# EAGLE design CPUinterface (EAGLE 9.6.2)
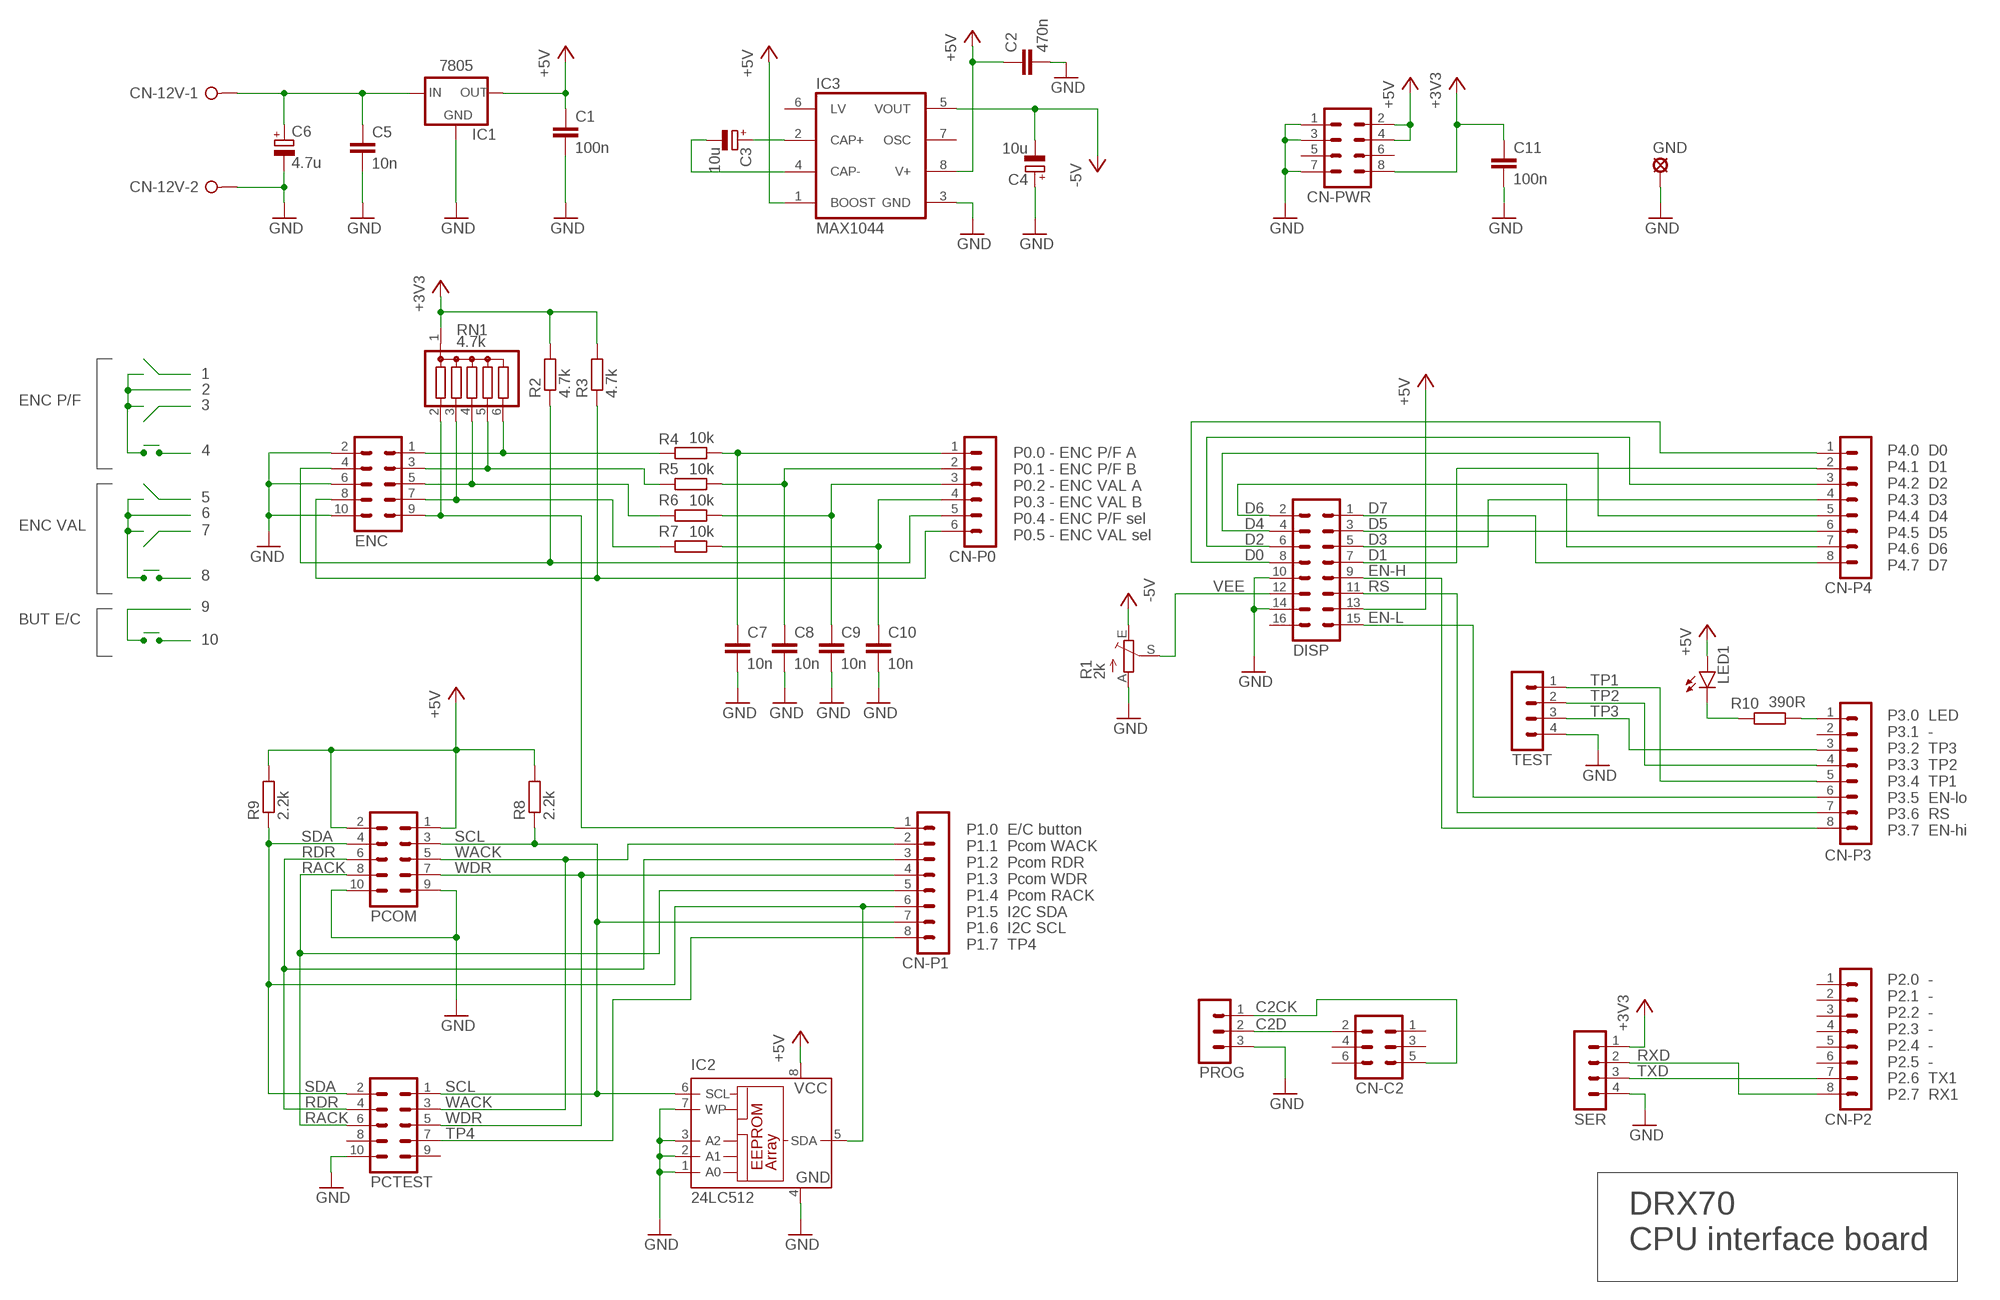
[diagram p0: schematic, sheet 1]

## Parts
C1  100n  C-EUC0805  [C0805]
C2  470n  C-EUC0603  [C0603]
C3  10u  CPOL-EUE2.5-6  [E2,5-6]
C4  10u  CPOL-EUE2.5-6  [E2,5-6]
C5  10n  C-EUC0603  [C0603]
C6  4.7u  CPOL-EUSMCA  [SMC_A]
C7  10n  C-EUC0603  [C0603]
C8  10n  C-EUC0603  [C0603]
C9  10n  C-EUC0603  [C0603]
C10  10n  C-EUC0603  [C0603]
C11  100n  C-EUC0805  [C0805]
CN-12V  W237-02P  [W237-132]
CN-C2  MA03-2  [MA03-2]
CN-P0  MA06-1  [MA06-1]
CN-P1  MA08-1  [MA08-1]
CN-P2  MA08-1  [MA08-1]
CN-P3  MA08-1  [MA08-1]
CN-P4  MA08-1  [MA08-1]
CN-PWR  MA04-2  [MA04-2]
DISP  MA08-2  [MA08-2]
ENC  MA05-2  [MA05-2]
GND  LSP10  [LSP10]
IC1  7805  78XXL  [78XXL]
IC2  24LC512  24C04ASN  [SO-08]
IC3  MAX1044  ICL7660CPA  [DIL08]
LED1  LED3MM  [LED3MM]
PCOM  MA05-2  [MA05-2]
PCTEST  MA05-2  [MA05-2]
PROG  MA03-1  [MA03-1]
R1  2k  TRIM_EU-S63X  [S63X]
R2  4.7k  R-EU_R0805  [R0805]
R3  4.7k  R-EU_R0805  [R0805]
R4  10k  R-EU_R0805  [R0805]
R5  10k  R-EU_R0805  [R0805]
R6  10k  R-EU_R0805  [R0805]
R7  10k  R-EU_R0805  [R0805]
R8  2.2k  R-EU_R0805  [R0805]
R9  2.2k  R-EU_R0805  [R0805]
R10  390R  R-EU_R0805  [R0805]
RN1  4.7k  G05R  [SIL6]
SER  MA04-1  [MA04-1]
TEST  MA04-1  [MA04-1]

## Nets
+3V3: C11.1 CN-PWR.8 R2.2 R3.2 RN1.1 SER.1
+5V: C1.1 C2.1 CN-PWR.2 CN-PWR.4 DISP.13 IC1.OUT IC2.8(VCC) IC3.1(BOOST) IC3.8(V+) LED1.A PCOM.1 PCOM.2 R8.2 R9.2
+12V: C5.1 C6.+ CN-12V.1 IC1.IN
-5V: C4.- IC3.5(VOUT) R1.E
C2CK: CN-C2.5 PROG.1
C2D: CN-C2.2 PROG.2
D0: CN-P4.1 DISP.8
D1: CN-P4.2 DISP.7
D2: CN-P4.3 DISP.6
D3: CN-P4.4 DISP.5
D4: CN-P4.5 DISP.4
D5: CN-P4.6 DISP.3
D6: CN-P4.7 DISP.2
D7: CN-P4.8 DISP.1
EN-H: CN-P3.8 DISP.9
EN-L: CN-P3.6 DISP.15
GND: C1.2 C2.2 C4.+ C5.2 C6.- C7.2 C8.2 C9.2 C10.2 C11.2 CN-12V.2 CN-PWR.1 CN-PWR.3 CN-PWR.7 DISP.10 DISP.14 ENC.2 ENC.6 ENC.10 GND.MP IC1.GND IC2.1(A0) IC2.2(A1) IC2.3(A2) IC2.4(GND) IC2.7(WP) IC3.3(GND) PCOM.9 PCOM.10 PCTEST.10 PROG.3 R1.A SER.4 TEST.4
N$1: C3.+ IC3.2(CAP+)
N$2: C3.- IC3.4(CAP-)
N$4: CN-P3.1 R10.1
N$16: ENC.1 R4.2 RN1.6
N$18: ENC.3 R5.2 RN1.5
N$20: ENC.5 R6.2 RN1.4
N$21: ENC.7 R7.2 RN1.3
N$22: LED1.K(C) R10.2
N$24: CN-P1.1 ENC.9 RN1.2
N$25: C10.1 CN-P0.4 R7.1
N$26: C9.1 CN-P0.3 R6.1
N$27: C8.1 CN-P0.2 R5.1
N$28: C7.1 CN-P0.1 R4.1
N$29: CN-P0.6 ENC.8 R3.1
N$30: CN-P0.5 ENC.4 R2.1
RACK: CN-P1.5 PCOM.8 PCTEST.6
RDR: CN-P1.3 PCOM.6 PCTEST.4
RS: CN-P3.7 DISP.11
RXD: CN-P2.8 SER.2
SCL: CN-P1.7 IC2.6(SCL) PCOM.3 PCTEST.1 R8.1
SDA: CN-P1.6 IC2.5(SDA) PCOM.4 PCTEST.2 R9.1
TP1: CN-P3.5 TEST.1
TP2: CN-P3.4 TEST.2
TP3: CN-P3.3 TEST.3
TP4: CN-P1.8 PCTEST.7
TXD: CN-P2.7 SER.3
VEE: DISP.12 R1.S
WACK: CN-P1.2 PCOM.5 PCTEST.3
WDR: CN-P1.4 PCOM.7 PCTEST.5
Unconnected: CN-C2.1 CN-C2.3 CN-C2.4 CN-C2.6 CN-P2.1 CN-P2.2 CN-P2.3 CN-P2.4 CN-P2.5 CN-P2.6 CN-P3.2 CN-PWR.5 CN-PWR.6 DISP.16 IC3.6(LV) IC3.7(OSC) PCTEST.8 PCTEST.9

## Notes on the sheet
- 1
- 2
- ENC P/F
- 3
- 4
- 5
- 6
- ENC VAL
- 7
- P0.0 - ENC P/F A
  P0.1 - ENC P/F B
  P0.2 - ENC VAL A
  P0.3 - ENC VAL B
  P0.4 - ENC P/F sel
  P0.5 - ENC VAL sel
- 8
- P4.0  D0
  P4.1  D1
  P4.2  D2
  P4.3  D3
  P4.4  D4
  P4.5  D5
  P4.6  D6
  P4.7  D7
- 9
- BUT E/C
- 10
- P3.0  LED
  P3.1  -
  P3.2  TP3
  P3.3  TP2
  P3.4  TP1
  P3.5  EN-lo
  P3.6  RS
  P3.7  EN-hi
- P1.0  E/C button
  P1.1  Pcom WACK
  P1.2  Pcom RDR
  P1.3  Pcom WDR
  P1.4  Pcom RACK
  P1.5  I2C SDA
  P1.6  I2C SCL
  P1.7  TP4
- P2.0  -
  P2.1  -
  P2.2  -
  P2.3  -
  P2.4  -
  P2.5  -
  P2.6  TX1
  P2.7  RX1
- DRX70
  CPU interface board

## Library data of the parts
C1 C2 C5 C7-C11 = rcl:C-EU: CAPACITOR, European symbol; SPICEPREFIX: C
C3 C4 C6 = rcl:CPOL-EU: POLARIZED CAPACITOR, European symbol; SPICEPREFIX: C
CN-12V = con-wago-508:W237-02P: WAGO SREW CLAMP; OC_FARNELL: unknown; OC_NEWARK: unknown
CN-C2 = con-lstb:MA03-2: PIN HEADER; OC_FARNELL: unknown; OC_NEWARK: unknown
CN-P0 = con-lstb:MA06-1: PIN HEADER; OC_FARNELL: unknown; OC_NEWARK: unknown
CN-P1-CN-P4 = con-lstb:MA08-1: PIN HEADER; OC_FARNELL: unknown; OC_NEWARK: unknown
CN-PWR = con-lstb:MA04-2: PIN HEADER; OC_FARNELL: unknown; OC_NEWARK: unknown
DISP = con-lstb:MA08-2: PIN HEADER; OC_FARNELL: unknown; OC_NEWARK: unknown
ENC PCOM PCTEST = con-lstb:MA05-2: PIN HEADER; OC_FARNELL: unknown; OC_NEWARK: unknown
GND = solpad:LSP10: SOLDER PAD drill 1.0 mm, distributor Buerklin, 12H555
IC1 = v-reg:78XXL: VOLTAGE REGULATOR
IC2 = microchip:24C*: Serial EEPROM 1 K/2 K/4 K; OC_FARNELL: unknown; OC_NEWARK: unknown
IC3 = maxim-2:ICL7660CPA: VOLTAGE CONVERTER; MF: INTERSIL; MPN: ICL7660CPA; OC_FARNELL: 1018170; OC_NEWARK: 06F7441
LED1 = led:LED: LED OSRAM: - CHIPLED LG R971, LG N971, LY N971, LG Q971, LY Q971, LO R971, LY R971 LH N974, LH R974 LS Q976, LO Q976, LY Q976 LO Q996 - Hyper CHIPLED LW Q18S LB Q993, LB Q99A, LB R99A - SideLED LS A670, LO A670, LY A670, LG A670, LP A670 LB A673, LV A673, LT A673, LW A673 LH A674 LY A675 LS A676, LA A676, LO A676, LY A676, LW A676 LS A679, LY A679, LG A679 - Hyper Micro SIDELED® LS Y876, LA Y876, LO Y876, LY Y876 LT Y87S - SmartLED LW L88C, LW L88S LB L89C, LB L89S, LG L890 LS L89K, LO L89K, LY L89K LS L896, LA L896, LO L896, LY L896 - TOPLED LS T670, LO T670, LY T670, LG T670, LP T670 LSG T670, LSP T670, LSY T670, LOP T670, LYG T670 LG T671, LOG T671, LSG T671 LB T673, LV T673, LT T673, LW T673 LH T674 LS T676, LA T676, LO T676, LY T676, LB T676, LH T676, LSB T676, LW T676 LB T67C, LV T67C, LT T67C, LS T67K, LO T67K, LY T67K, LW E67C LS E67B, LA E67B, LO E67B, LY E67B, LB E67C, LV E67C, LT E67C LW T67C LS T679, LY T679, LG T679 LS T770, LO T770, LY T770, LG T770, LP T770 LB T773, LV T773, LT T773, LW T773 LH T774 LS E675, LA E675, LY E675, LS T675 LS T776, LA T776, LO T776, LY T776, LB T776 LHGB T686 LT T68C, LB T68C - Hyper Mini TOPLED® LB M676 - Mini TOPLED Santana® LG M470 LS M47K, LO M47K, LY M47K Source: http://www.osram.convergy.de LUXEON: - LUMILED® LXK2-PW12-R00, LXK2-PW12-S00, LXK2-PW14-U00, LXK2-PW14-V00 LXK2-PM12-R00, LXK2-PM12-S00, LXK2-PM14-U00 LXK2-PE12-Q00, LXK2-PE12-R00, LXK2-PE12-S00, LXK2-PE14-T00, LXK2-PE14-U00 LXK2-PB12-K00, LXK2-PB12-L00, LXK2-PB12-M00, LXK2-PB14-N00, LXK2-PB14-P00, LXK2-PB14-Q00 LXK2-PR12-L00, LXK2-PR12-M00, LXK2-PR14-Q00, LXK2-PR14-R00 LXK2-PD12-Q00, LXK2-PD12-R00, LXK2-PD12-S00 LXK2-PH12-R00, LXK2-PH12-S00 LXK2-PL12-P00, LXK2-PL12-Q00, LXK2-PL12-R00 Source: www.luxeon.com KINGBRIGHT: KA-3528ASYC Source: www.kingbright.com
PROG = con-lstb:MA03-1: PIN HEADER; OC_FARNELL: unknown; OC_NEWARK: unknown
R1 = pot:TRIM_EU-: POTENTIOMETER
R2-R10 = rcl:R-EU_: RESISTOR, European symbol; SPICEPREFIX: R
RN1 = resistor-sil:G05R: SIL RESISTOR; OC_FARNELL: unknown; OC_NEWARK: unknown
SER TEST = con-lstb:MA04-1: PIN HEADER; OC_FARNELL: unknown; OC_NEWARK: unknown

## Board
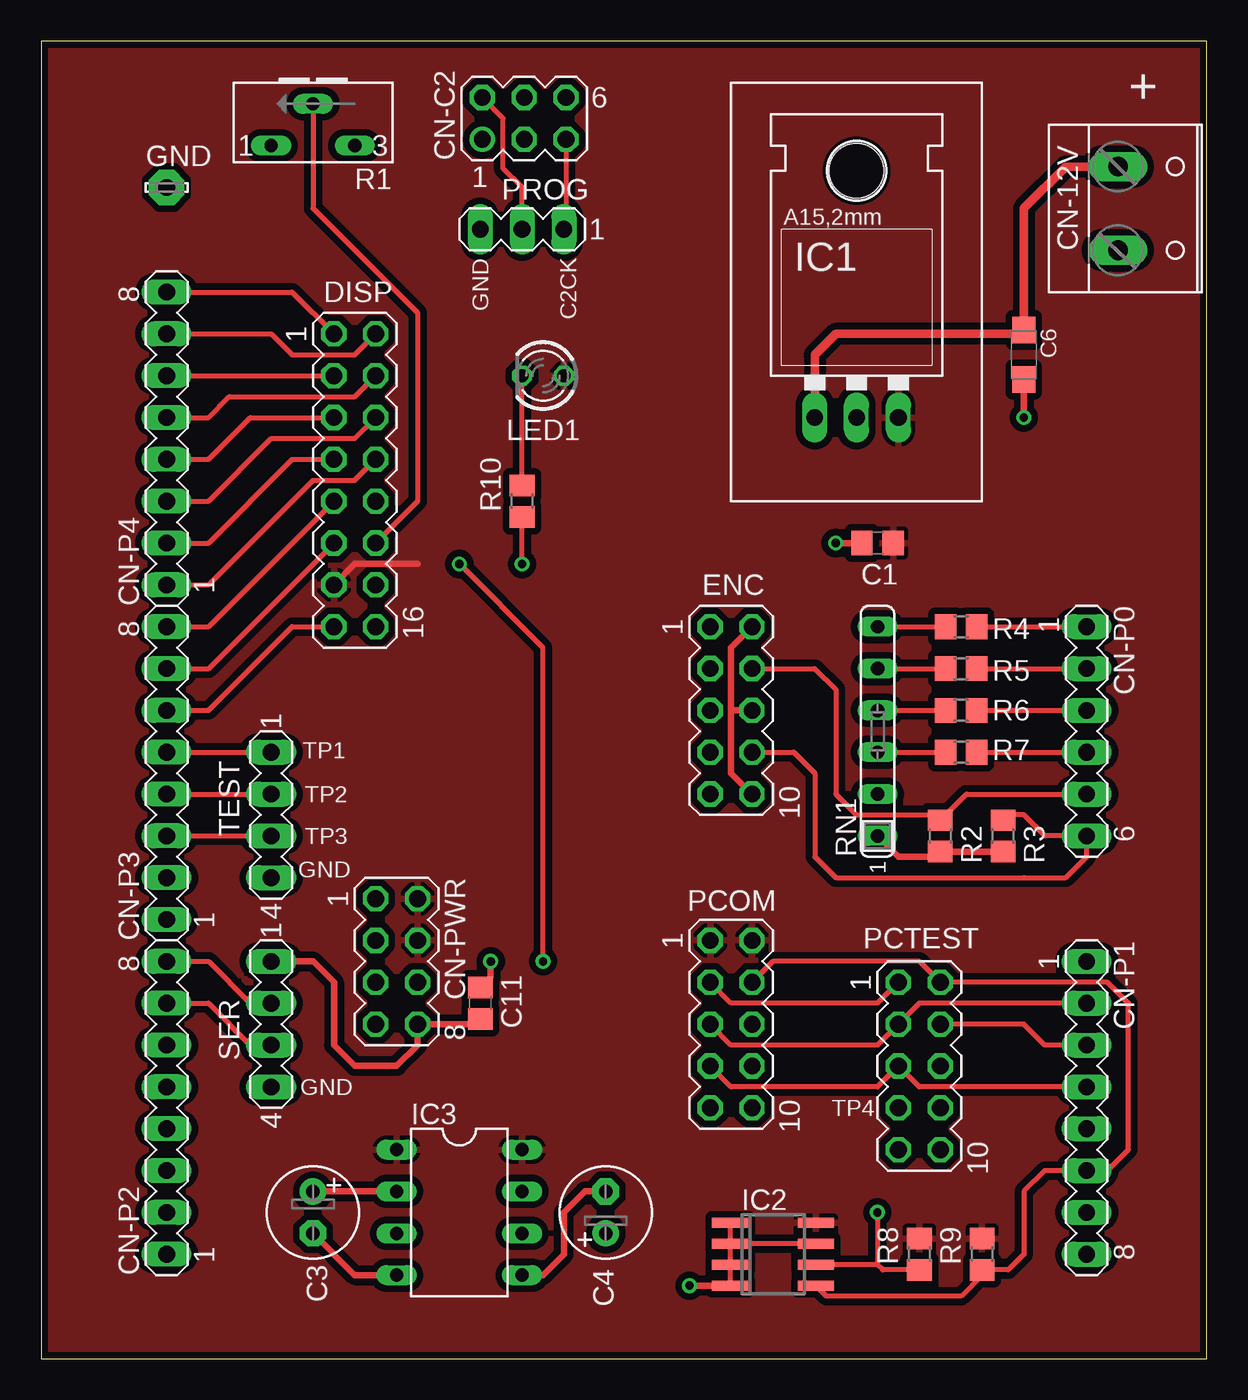
[diagram p1: board, top side]
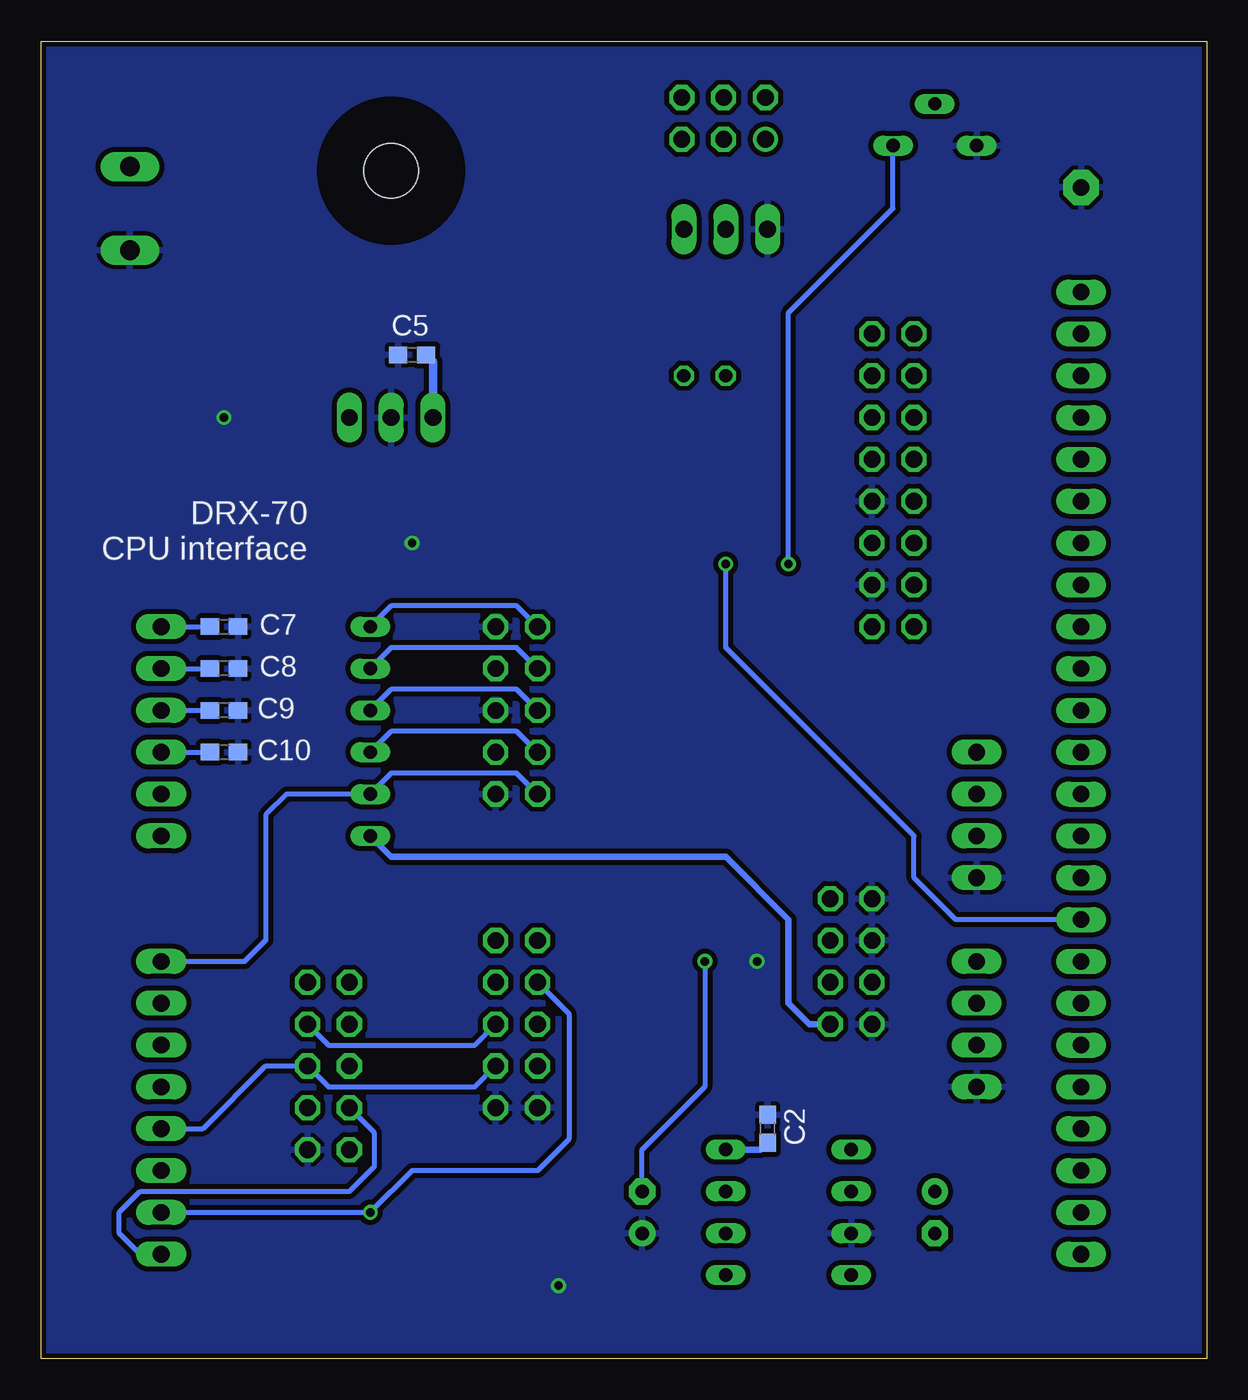
[diagram p2: board, bottom side, seen from below]

Size 70.79 x 80 mm. Coordinates in mm from the lower left corner, seen from the top.
Outline: 0,0 70.79,0 70.79,80 0,80 0,0
Copper layers (1*16): Top 0.035mm / dielectric 1.5mm / Bottom 0.035mm
Design rules "aisler_2_layer_simple_mod": minimum track width 0.1mm, minimum drill 0.3mm, track to track 0.1mm, track to pad 0.1mm, pad to pad 0.1mm, via to via 0.1mm, smd to smd 0.1mm, copper to edge 0.3mm, drill to drill 0.25mm, minimum pad ring 0.2mm, minimum via ring 0.2mm, stop-mask expansion 0mil, vias tented up to drill 20mil, thermal gap 10mil

### Footprints (pad centres in the part's own frame; a part is rotated, then mirrored left to right if it is on the bottom)
C0805 = smd 1.3 x 1.5: 1 -0.95,0; 2 0.95,0
C0603 = smd 1.1 x 1: 1 -0.85,0; 2 0.85,0
E2,5-6 = drill 0.813 pad 1.6: + -1.27,0 | drill 0.813 pad 1.6 octagon: - 1.27,0
SMC_A = smd 1.6 x 1.4: + -1.5,0; - 1.5,0
W237-132 = drill 1.194 long: 1 -2.54,-0.635; 2 2.54,-0.635
MA03-2 = drill 1.016: 1 -2.54,-1.27 | drill 1.016 octagon: 2 -2.54,1.27; 3 0,-1.27; 4 0,1.27; 5 2.54,-1.27; 6 2.54,1.27
MA06-1 = drill 1.016 long: 1 -6.35,0; 2 -3.81,0; 3 -1.27,0; 4 1.27,0; 5 3.81,0; 6 6.35,0
MA08-1 = drill 1.016 long: 1 -8.89,0; 2 -6.35,0; 3 -3.81,0; 4 -1.27,0; 5 1.27,0; 6 3.81,0; 7 6.35,0; 8 8.89,0
MA04-2 = drill 1.016 octagon: 1 -3.81,-1.27; 2 -3.81,1.27; 3 -1.27,-1.27; 4 -1.27,1.27; 5 1.27,-1.27; 6 1.27,1.27; 7 3.81,-1.27; 8 3.81,1.27
MA08-2 = drill 1.016 octagon: 1 -8.89,-1.27; 2 -8.89,1.27; 3 -6.35,-1.27; 4 -6.35,1.27; 5 -3.81,-1.27; 6 -3.81,1.27; 7 -1.27,-1.27; 8 -1.27,1.27; 9 1.27,-1.27; 10 1.27,1.27; 11 3.81,-1.27; 12 3.81,1.27; 13 6.35,-1.27; 14 6.35,1.27; 15 8.89,-1.27; 16 8.89,1.27
MA05-2 = drill 1.016 octagon: 1 -5.08,-1.27; 2 -5.08,1.27; 3 -2.54,-1.27; 4 -2.54,1.27; 5 0,-1.27; 6 0,1.27; 7 2.54,-1.27; 8 2.54,1.27; 9 5.08,-1.27; 10 5.08,1.27
LSP10 = drill 1.016 pad 2.159 octagon: MP 0,0
78XXL = drill 1.016 long: GND 0,-3.81; IN -2.54,-3.81; OUT 2.54,-3.81 | hole 3.302: 0,11.176
SO-08 = smd 0.6 x 2.2: 1 -1.905,-2.6; 2 -0.635,-2.6; 3 0.635,-2.6; 4 1.905,-2.6; 5 1.905,2.6; 6 0.635,2.6; 7 -0.635,2.6; 8 -1.905,2.6
DIL08 = drill 0.813 long: 1 -3.81,-3.81; 2 -1.27,-3.81; 3 1.27,-3.81; 4 3.81,-3.81; 5 3.81,3.81; 6 1.27,3.81; 7 -1.27,3.81; 8 -3.81,3.81
LED3MM = drill 0.813 octagon: A -1.27,0; K 1.27,0
MA03-1 = drill 1.016 long: 1 -2.54,0; 2 0,0; 3 2.54,0
S63X = drill 0.813 long: A 2.54,0; E -2.54,0; S 0,-2.54
R0805 = smd 1.3 x 1.5: 1 -0.95,0; 2 0.95,0
SIL6 = drill 0.813 long: 1 -6.35,0; 2 -3.81,0; 3 -1.27,0; 4 1.27,0; 5 3.81,0; 6 6.35,0
MA04-1 = drill 1.016 long: 1 -3.81,0; 2 -1.27,0; 3 1.27,0; 4 3.81,0

### Placement (x,y rotation side)
C1  50.8,49.53 180 top
C2  26.67,13.97 90 bottom
C3  16.51,8.89 270 top
C4  34.29,8.89 90 top
C5  48.26,60.96 180 bottom
C6  59.69,60.96 270 top
C7  59.69,44.45 0 bottom
C8  59.69,41.91 0 bottom
C9  59.69,39.37 0 bottom
C10  59.69,36.83 0 bottom
C11  26.67,21.59 90 top
CN-12V  66.04,69.85 270 top
CN-C2  29.34,75.31 0 top
CN-P0  63.5,38.1 270 top
CN-P1  63.5,15.24 270 top
CN-P2  7.62,15.24 90 top
CN-P3  7.62,35.56 90 top
CN-P4  7.62,55.88 90 top
CN-PWR  21.59,24.13 270 top
DISP  19.05,53.34 270 top
ENC  41.91,39.37 270 top
GND  7.62,71.12 0 top
IC1  49.53,60.96 0 top
IC2  44.45,6.35 270 top
IC3  25.4,8.89 270 top
LED1  30.48,59.69 180 top
PCOM  41.91,20.32 270 top
PCTEST  53.34,17.78 270 top
PROG  29.21,68.58 180 top
R1  16.51,73.66 180 top
R2  54.61,31.75 270 top
R3  58.42,31.75 270 top
R4  55.88,44.45 180 top
R5  55.88,41.91 180 top
R6  55.88,39.37 180 top
R7  55.88,36.83 180 top
R8  53.34,6.35 90 top
R9  57.15,6.35 90 top
R10  29.21,52.07 90 top
RN1  50.8,38.1 90 top
SER  13.97,20.32 270 top
TEST  13.97,33.02 270 top

### Tracks (layer width: path | path; a pad name or v marks a point on that pad's centre or on a via)
+3V3
  Top 0.305: 26.35,20.32 C11.1 | R2.2 54.29,30.48
  Top 0.406: SER.1 16.51,24.13 17.78,22.86 17.78,19.05 19.05,17.78 21.59,17.78 22.86,19.05 CN-PWR.8 26.35,20.32 | R3.2 R2.2 | 54.29,30.48 52.07,30.48 RN1.1
  Bottom 0.406: RN1.1 49.53,30.48 29.21,30.48 25.4,26.67 25.4,21.59 24.13,20.32 CN-PWR.8
+5V
  Top 0.406: DISP.13 19.05,48.26 22.86,48.26
  Bottom 0.406: C2.1 27.09,12.7 IC3.8
  pour Top (isolate 0.406): -1.27,81.28 72.39,81.28 72.39,-1.27 -1.27,-1.27
+12V
  Top 0.305: C6.+ 59.46,62.23
  Top 0.508: CN-12V.1 62.23,72.39 59.69,69.85 C6.+ | IC1.IN 46.99,60.96 48.26,62.23 59.46,62.23
  Bottom 0.508: IC1.IN 46.99,60.54 C5.1
-5V  (via drill 0.5)
  Top 0.305: v30.48,24.13 30.48,43.18 v25.4,48.26
  Top 0.406: IC3.5 30.48,5.08 31.75,6.35 31.75,8.89 33.02,10.16 C4.-
  Bottom 0.305: C4.- 34.29,12.7 30.48,16.51 v30.48,24.13 | v25.4,48.26 25.4,63.5 19.05,69.85 R1.E
C2CK
  Top 0.305: CN-C2.5 31.88,68.71 PROG.1
C2D
  Top 0.305: PROG.2 29.21,71.12 28.07,72.26 28.07,75.31 CN-C2.2
D0
  Top 0.305: CN-P4.1 10.16,46.99 16.51,53.34 19.05,53.34 DISP.8
D1
  Top 0.305: CN-P4.2 10.16,49.53 15.24,54.61 DISP.7
D2
  Top 0.305: CN-P4.3 10.16,52.07 13.97,55.88 19.05,55.88 DISP.6
D3
  Top 0.305: CN-P4.4 10.16,54.61 12.7,57.15 DISP.5
D4
  Top 0.305: CN-P4.5 10.16,57.15 11.43,58.42 19.05,58.42 DISP.4
D5
  Top 0.305: CN-P4.6 DISP.3
D6
  Top 0.305: CN-P4.7 13.97,62.23 15.24,60.96 19.05,60.96 DISP.2
D7
  Top 0.305: CN-P4.8 15.24,64.77 DISP.1
EN-H
  Top 0.305: CN-P3.8 10.16,44.45 DISP.9
EN-L
  Top 0.305: CN-P3.6 10.16,39.37 15.24,44.45 DISP.15
GND  (via drill 0.5)
  Top 0.305: IC2.1 IC2.2 | IC2.2 IC2.3 IC2.4 | IC2.7 IC2.2
  Top 0.406: C6.- v59.69,57.15 | C1.2 v48.26,49.53 | v27.3,24.13 27.3,23.18 C11.2 | IC2.4 v39.37,4.45 | ENC.10 41.91,35.56 41.91,39.37 | 41.91,39.37 ENC.6 | 41.91,39.37 41.91,43.18 ENC.2
  pour Bottom (isolate 0.305): -1.27,81.28 72.39,81.28 72.39,-1.27 -1.27,-1.27
N$1
  Top 0.406: C3.+ IC3.2
N$2
  Top 0.406: C3.- 19.05,5.08 IC3.4
N$4  (via drill 0.5)
  Top 0.305: v29.21,48.26 R10.1
  Bottom 0.305: CN-P3.1 15.24,26.67 17.78,29.21 17.78,31.75 29.21,43.18 v29.21,48.26
N$16
  Top 0.305: RN1.6 R4.2
  Bottom 0.305: ENC.1 41.91,45.72 49.53,45.72 RN1.6
N$18
  Top 0.305: RN1.5 R5.2
  Bottom 0.305: ENC.3 41.91,43.18 49.53,43.18 RN1.5
N$20
  Top 0.305: RN1.4 R6.2
  Bottom 0.305: ENC.5 41.91,40.64 49.53,40.64 RN1.4
N$21
  Top 0.305: RN1.3 R7.2
  Bottom 0.305: ENC.7 41.91,38.1 49.53,38.1 RN1.3
N$22
  Top 0.305: R10.2 LED1.K
N$24
  Bottom 0.305: ENC.9 41.91,35.56 49.53,35.56 RN1.2 55.88,34.29 57.15,33.02 57.15,25.4 58.42,24.13 CN-P1.1
N$25
  Top 0.305: R7.1 CN-P0.4
  Bottom 0.305: CN-P0.4 C10.1
N$26
  Top 0.305: R6.1 CN-P0.3
  Bottom 0.305: CN-P0.3 C9.1
N$27
  Top 0.305: R5.1 CN-P0.2
  Bottom 0.305: CN-P0.2 C8.1
N$28
  Top 0.305: R4.1 CN-P0.1
  Bottom 0.305: CN-P0.1 C7.1
N$29
  Top 0.305: ENC.8 45.72,36.83 46.99,35.56 46.99,30.48 48.26,29.21 59.69,29.21 62.23,29.21 63.5,30.48 CN-P0.6 60.96,31.75 59.69,33.02 58.74,33.02 R3.1
N$30
  Top 0.305: ENC.4 46.99,41.91 48.26,40.64 48.26,34.29 49.53,33.02 54.29,33.02 R2.1 56.2,34.29 CN-P0.5
RACK
  Bottom 0.305: CN-P1.5 60.96,13.97 57.15,17.78 PCTEST.6 53.34,16.51 44.45,16.51 PCOM.8
RDR
  Top 0.305: CN-P1.3 60.96,19.05 59.69,20.32 PCTEST.4
  Bottom 0.305: PCTEST.4 53.34,19.05 44.45,19.05 PCOM.6
RS
  Top 0.305: CN-P3.7 10.16,41.91 DISP.11
RXD
  Top 0.305: CN-P2.8 10.16,24.13 12.7,21.59 SER.2
SCL  (via drill 0.5)
  Top 0.305: v50.8,8.89 50.8,5.71 | 50.8,5.71 IC2.6 | R8.1 51.12,5.4 50.8,5.71 | PCTEST.1 50.8,21.59 41.91,21.59 PCOM.3
  Bottom 0.305: CN-P1.7 v50.8,8.89 48.26,11.43 40.64,11.43 38.73,13.34 38.73,20.95 PCOM.3
SDA
  Top 0.305: PCOM.4 44.45,24.13 53.34,24.13 PCTEST.2 64.77,22.86 66.04,21.59 66.04,12.7 64.77,11.43 CN-P1.6 60.96,11.43 59.69,10.16 59.69,6.35 58.74,5.4 R9.1 57.15,5.08 55.88,3.81 47.69,3.81 IC2.5
TP1
  Top 0.305: CN-P3.5 TEST.1
TP2
  Top 0.305: CN-P3.4 TEST.2
TP3
  Top 0.305: CN-P3.3 TEST.3
TP4
  Bottom 0.305: CN-P1.8 64.77,6.35 66.04,7.62 66.04,8.89 64.77,10.16 52.07,10.16 50.55,11.68 50.55,13.72 PCTEST.7
TXD
  Top 0.305: CN-P2.7 10.16,21.59 12.7,19.05 SER.3
VEE
  Top 0.305: R1.S 16.51,69.85 22.86,63.5 22.86,52.07 DISP.12
WACK
  Top 0.305: CN-P1.2 53.34,21.59 PCTEST.3 50.8,19.05 41.91,19.05 PCOM.5
WDR
  Top 0.305: CN-P1.4 53.34,16.51 PCTEST.5 50.8,16.51 41.91,16.51 PCOM.7

### Text on the board
tNames: + | GND | C2CK | TP1 | TP2 | TP3 | GND | GND | TP4
bNames: DRX-70 / CPU interface